# Altium project IT_SENSOR_PCB.PrjPcb (part 1 of 2)
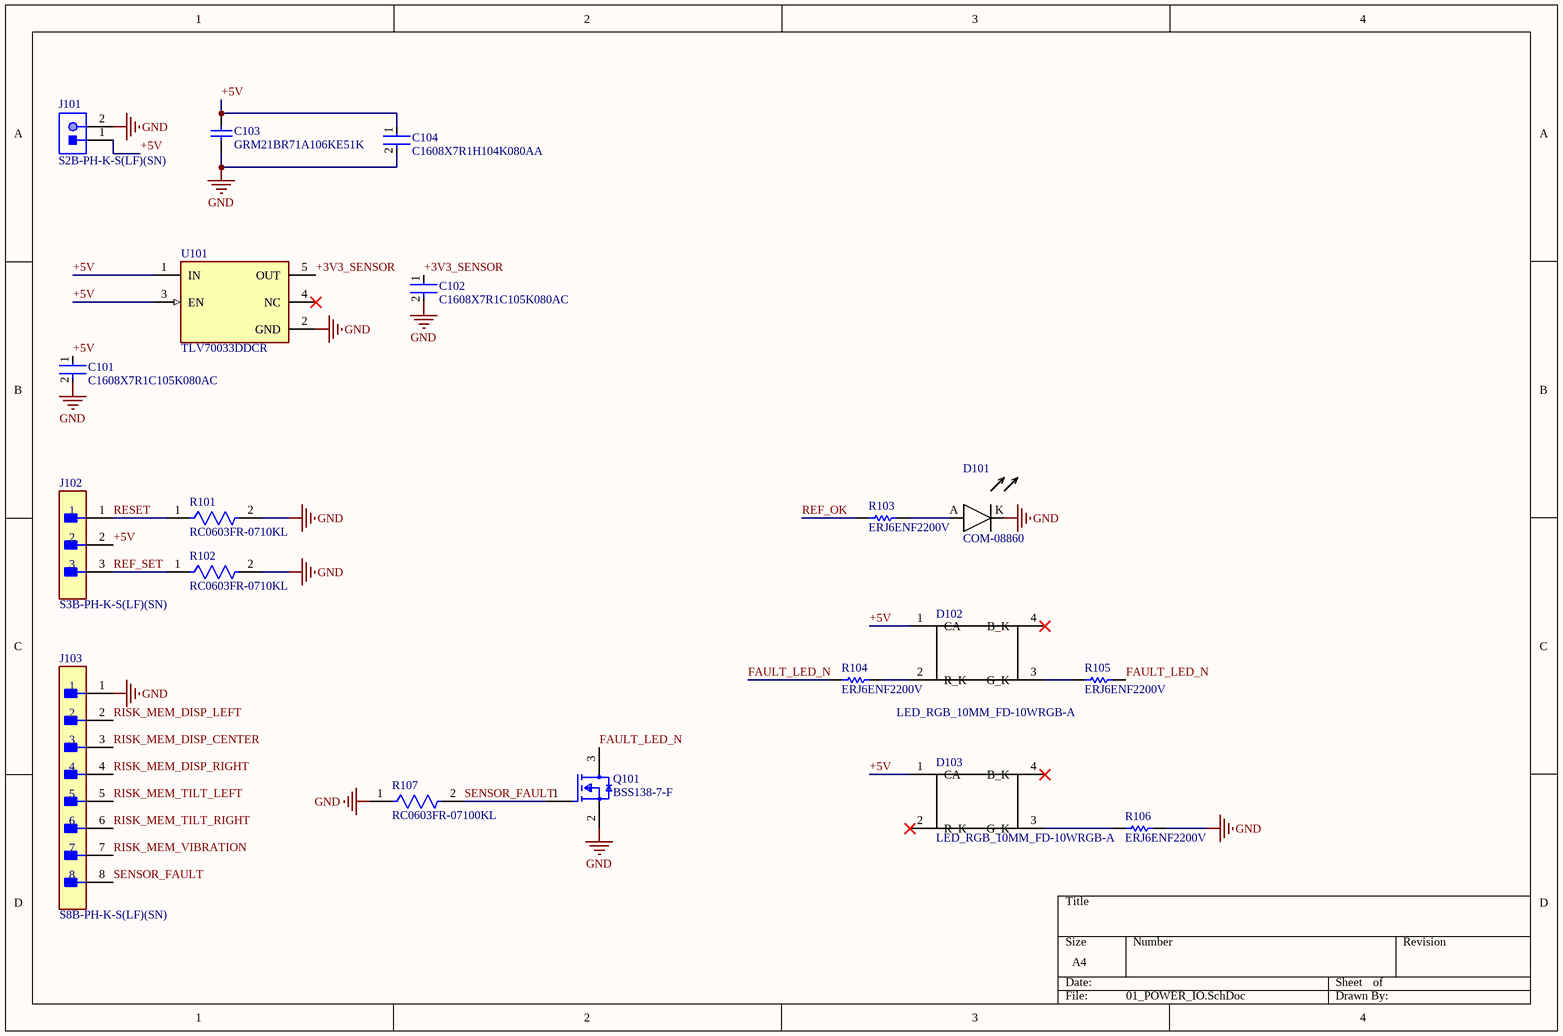
[diagram p0: 01_POWER_IO.SchDoc]
6 sheets, 106 parts. Net scope: global (net labels, ports and power ports of the same name join across sheets).
Board file: IT_SENSOR_PCB.PcbDoc
Sheets:
  01_POWER_IO.SchDoc
  02_DISPLACEMENT.SchDoc
  03_TILT_REF.SchDoc
  04_VIBRATION_FAULT.SchDoc
  05_RISK_MEMORY.SchDoc
  06_RISK_ALERT.SchDoc

## Sheet 01_POWER_IO.SchDoc
size A4; SheetNumber: 1; SheetTotal: 6

### Parts
C101  C1608X7R1C105K080AC  [FP-C1608-080-0_1-IPC_B]
C102  C1608X7R1C105K080AC  [FP-C1608-080-0_1-IPC_B]
C103  GRM21BR71A106KE51K  [CAPC2013X140X45ML15T25]
C104  C1608X7R1H104K080AA  [FP-C1608-080-0_1-IPC_B]
D101  COM-08860  [LED_10MM_COM-08860]
D102  LED_RGB_10MM_FD-10WRGB-A  [LED_THT_RGB_10MM_FD10WRGBA]
D103  LED_RGB_10MM_FD-10WRGB-A  [LED_THT_RGB_10MM_FD10WRGBA]
J101  S2B-PH-K-S(LF)(SN)  [JST-S2B-PH-K-S_V]
J102  S3B-PH-K-S(LF)(SN)  [FP-S3B-PH-K-S_LF_SN-MFG]
J103  S8B-PH-K-S(LF)(SN)  [FP-S8B-PH-K-S_LF_SN-MFG]
Q101  BSS138-7-F  [FP-SOT23_Standard-MFG]
R101  RC0603FR-0710KL  [FP-RC0603-0_55-IPC_C]
R102  RC0603FR-0710KL  [FP-RC0603-0_55-IPC_C]
R103  ERJ6ENF2200V  [RESC2013X70X40NL20T20]
R104  ERJ6ENF2200V  [RESC2013X70X40NL20T20]
R105  ERJ6ENF2200V  [RESC2013X70X40NL20T20]
R106  ERJ6ENF2200V  [RESC2013X70X40NL20T20]
R107  RC0603FR-07100KL  [FP-RC0603-0_55-MFG]
U101  TLV70033DDCR  [FP-DDC0005A-IPC_A]

### Nets
GND: C101.2 C102.2 C103.1 C104.2 D101.K(CATHODE) J101.2 J103.1 Q101.2(S) R101.2 R102.2 R106.2 R107.1 U101.2(GND)
+3V3_SENSOR: C102.1 U101.5(OUT)
+5V: C101.1 C103.2 C104.1 D102.1(CA) D103.1(CA) J101.1 J102.2 U101.1(IN) U101.3(EN)
FAULT_LED_N: Q101.3(D) R104.1 R105.2
REF_OK: R103.1
REF_SET: J102.3 R102.1
RESET: J102.1 R101.1
RISK_MEM_DISP_CENTER: J103.3
RISK_MEM_DISP_LEFT: J103.2
RISK_MEM_DISP_RIGHT: J103.4
RISK_MEM_TILT_LEFT: J103.5
RISK_MEM_TILT_RIGHT: J103.6
RISK_MEM_VIBRATION: J103.7
SENSOR_FAULT: J103.8 Q101.1(G) R107.2
NetD101_A: D101.A(ANODE) R103.2
NetD102_2: D102.2(R_K) R104.2
NetD102_3: D102.3(G_K) R105.1
NetD103_3: D103.3(G_K) R106.1

Not connected (* = marked no-connect by the designer): D102 4(B_K)*; D103 2(R_K)* 4(B_K)*; U101 4(NC)*

### Notes on the sheet
- (in symbol CMP-05427-000141-1) +
- (in symbol SC56-11EWA) A; B; C; D; E; F; G; DP

### Library data of the parts
C101 C102 = CMP-08246-002727-1: Multilayer Ceramic Capacitors 1μF ±10% 16V X7R SMD 0603; Capacitance: 1uF; Mount: Surface Mount; Width: 0.031inch; Radiation Hardening: No; Dielectric Material: Ceramic; Packaging: Tape and Reel; Voltage Rating: 16V; Weight: 7.1E-05oz; Termination: SMD/SMT; Package Quantity: 1; Voltage Rating (DC): 16V; REACH SVHC: No SVHC; Voltage: 16V; Min Operating Temperature: -55°C; Depth: 0.8mm; Height: 0.8mm; Length: 1.6mm; Case Code (Metric): 1608; Thickness: 0.037inch; Lead Free: Lead Free; Resistor Type: Ceramic; RoHS Compliant: Yes; Series: C; Construction: Flat; Max Operating Temperature: 125°C; Tolerance: 10%; Case/Package: 0603; Dielectric: X7R; Case Code (Imperial): 0603
C103 = CMP-2007-03370-1: Manufacturer: Murata; Part Number: GRM21BR71A106KE51K
C104 = CMP-2000-04982-2: Multilayer Ceramic Capacitors 100nF ±10% 50V X7R SMD 0603; REACH SVHC: No SVHC; Voltage: 50V; Min Operating Temperature: -55°C; Package Quantity: 1; Case Code (Metric): 1608; Series: C; Termination: SMD/SMT; Length: 1.6mm; Voltage Rating: 50V; Case Code (Imperial): 0603; Number of Pins: 2; RoHS Compliant: Yes; Thickness: 0.037inch; Resistor Type: Ceramic; Radiation Hardening: No; Weight: 7.1E-05oz; Mount: Surface Mount; Capacitance: 100nF; Voltage Rating (DC): 50V; Construction: Flat; Tolerance: 10%; Lead Free: Lead Free; Case/Package: 0603; Max Operating Temperature: 125°C; Height: 0.8mm; Depth: 0.8mm; Packaging: Tape and Reel; Width: 0.031inch; Dielectric Material: Ceramic; Dielectric: X7R
D101 = COM-08860: Blue 10mm THT LED
J101 = CMP-1755-00004-1: Male Header, Pitch 2 mm, 1 x 2 Position, Height 4.8 mm, Tail Length 3.4 mm, -25 to 85 degC, RoHS, Bulk; Case\Package: Radial; Tolerance: 20%; Capacitance: 10 uF; Voltage Rating (DC): 50 V; Packaging: Bulk; ComponentLink1URL: http://www.jst-mfg.com/product/pdf/eng/ePH.pdf; Radiation Hardening: No; Height: 11 mm; Package Quantity: 200; PackageDescription: Male Header, Pitch 2 mm, 1 x 2 Position, Height 4.8 mm, Tail Length 3.4 mm; PackageReference: S2B-PH-K-S; Diameter: 5 mm; Pins: 2; Mount: Through Hole; Max Operating Temperature: 85 degC; Min Operating Temperature: -40 degC; ComponentLink1Description: Datasheet; DatasheetVersion: Dec-12; Length: 11 mm; Lead Pitch: 2 mm; REACH SVHC: No SVHC; Voltage Rating: 50 V; RoHSCompliant: true
J102 = CMP-17439-000039-1: CONN HEADER R/A 3POS 2MM; Height: 0.31inch; Weight: 0.0625lb; Length: 0.31inch; Width: 0.31inch
J103 = CMP-17439-000161-1: CONN HEADER R/A 8POS 2MM; Number of Positions: 8; Voltage Rating: 100V; Insulation Resistance: 1GR; Current Rating: 2A; Gender: Male; Contact Resistance: 20mR; Contact Mating Length: 0.13inch; Width: 4.5mm; Contact Finish - Mating: TIN; Insulation Color: Natural; Housing Color: White; Depth: 7.6mm; Min Operating Temperature: -25°C; Lead Pitch: 2mm; Number of Poles: 8; Number of Rows: 1; Height: 9.4mm; REACH SVHC: No SVHC; Contact Type: Male Pin; Length: 17.9mm; Lead Free: Lead Free; Pitch: 2mm; Number of Contacts: 8; Orientation: Right Angle; Flammability Rating: UL94 V-0; Max Operating Temperature: 85°C; Mount: Through Hole; Contact Shape: Square; Termination: Solder; Fastening Type: Detent; Packaging: Bulk; Series: PH; Voltage Rating (AC): 100V; Insulation Material: Nylon; Working Voltage: 100V; Contact Plating: Tin; Housing Material: Polyamide; Connector Type: Header; Number of Pins: 8; Max Voltage Rating (AC): 100V; Max Current Rating: 2A; Contact Material: Brass; Color: White
Q101 = CMP-2000-04930-2: NexarPartId: 335900; Voltage: 50V; Fall Time: 25ns; Number of Elements: 1; Turn-On Delay Time: 20ns; Drain to Source Resistance: 1.4Ω; Element Configuration: Single; Max Power Dissipation: 300mW; Current Rating: 200mA; Max Junction Temperature (Tj): 150°C; Input Capacitance: 50pF; Threshold Voltage: 1.2V; Current: 2A; Rds On Max: 3.5Ω; Rise Time: 10ns; Gate to Source Voltage (Vgs): 20V; Number of Pins: 3; Width: 1.3mm; Case/Package: SOT-23; Lead Free: Lead Free; Height: 1.15mm; Packaging: Cut Tape; Length: 2.9mm; REACH SVHC: No SVHC; Weight: 7.994566mg; Voltage Rating (DC): 50V; Contact Plating: Tin; Power Dissipation: 300mW; Mount: Surface Mount; Min Operating Temperature: -55°C; RoHS: Compliant; Max Operating Temperature: 150°C; Schedule B: 8541210080, 8541210080; Drain to Source Breakdown Voltage: 50V; Continuous Drain Current (ID): 200mA; Resistance: 3.5Ω; Number of Channels: 1; Drain to Source Voltage (Vdss): 50V; Turn-Off Delay Time: 20ns; Nominal Vgs: 1.2V
R101 R102 = CMP-2100-03664-2: RES 10K OHM 1% 1/10W 0603; Voltage Rating: 75V; Voltage Rating (DC): 50V; Resistance: 10kR; Power Rating: 100mW; Temperature Coefficient: 100ppm/°C; Depth: 0.8mm; Termination: SMD/SMT; Resistor Type: Thick Film; Series: RC; Construction: Rectangular; Features: Moisture Resistant; Packaging: Tape and Reel; Min Operating Temperature: -55°C; Number of Terminations: 2; Lead Pitch: 0.3mm; RoHS Compliant: Yes; Case/Package: 0603; Resistance Tolerance: 1%; Military Standard: Not; Weight: 7.1E-05oz; Number of Pins: 2; Tolerance: 1%; Length: 1.6mm; Case Code (Imperial): 0603; Lead Free: Lead Free; Width: 0.8mm; Max Power Dissipation: 100mW; Height: 0.45mm; Max Operating Temperature: 155°C; Case Code (Metric): 1608; Size Code: 0603
R103-R106 = CMP-2001-00044-1: Manufacturer: Panasonic; Part Number: ERJ6ENF2200V
R107 = CMP-2100-03662-2: RES SMD 100K OHM 1% 1/10W 0603; Voltage Rating (DC): 50V; Resistance: 100kR; Max Power Dissipation: 100mW; Temperature Coefficient: 100ppm/°C; Working Voltage: 75V; Length: 1.6mm; Lead Free: Lead Free; Number of Terminations: 2; Packaging: Tape and Reel; Voltage Rating: 50V; Termination: SMD/SMT; Width: 0.8mm; Resistor Type: Thick Film; Resistance Tolerance: 1%; Features: Moisture Resistant; Height: 0.45mm; Construction: Rectangular; Case/Package: 0603; Military Standard: Not; Case Code (Imperial): 0603; Series: RC; Technology: THICK FILM; Depth: 0.8mm; RoHS Compliant: Yes; REACH SVHC: No SVHC; Min Operating Temperature: -55°C; Case Code (Metric): 1608; Max Operating Temperature: 155°C; Power Rating: 100mW; Number of Pins: 2; Tolerance: 1%
U101 = CMP-0394-01056-3: IC REG LINEAR 3.3V 200MA SOT23-5; Number of Outputs: 1; Max Input Voltage: 5.5V; Dropout Voltage: 175mV; Output Voltage Accuracy: 2%; Min Current Limit: 220mA; Min Input Voltage: 2V; Max Power Dissipation: 500mW; Polarity: Positive; Output Type: Fixed; Quiescent Current: 30uA; Output Current: 200mA; Min Operating Temperature: -40°C; Number of Pins: 5; Package Quantity: 1; Max Operating Temperature: 125°C; Case/Package: TSOT; Max Output Voltage: 3.3V; Max Output Current: 200mA; REACH SVHC: No SVHC; Accuracy: 2%; Lead Free: Lead Free; Output Voltage: 3.3V; Radiation Hardening: No; Packaging: Tape and Reel; Nominal Output Voltage: 3.3V; Power Dissipation: 500mW; Number of Regulators: 1; Min Output Voltage: 3.3V

## Sheet 02_DISPLACEMENT.SchDoc
size A4; SheetNumber: 2; SheetTotal: 6
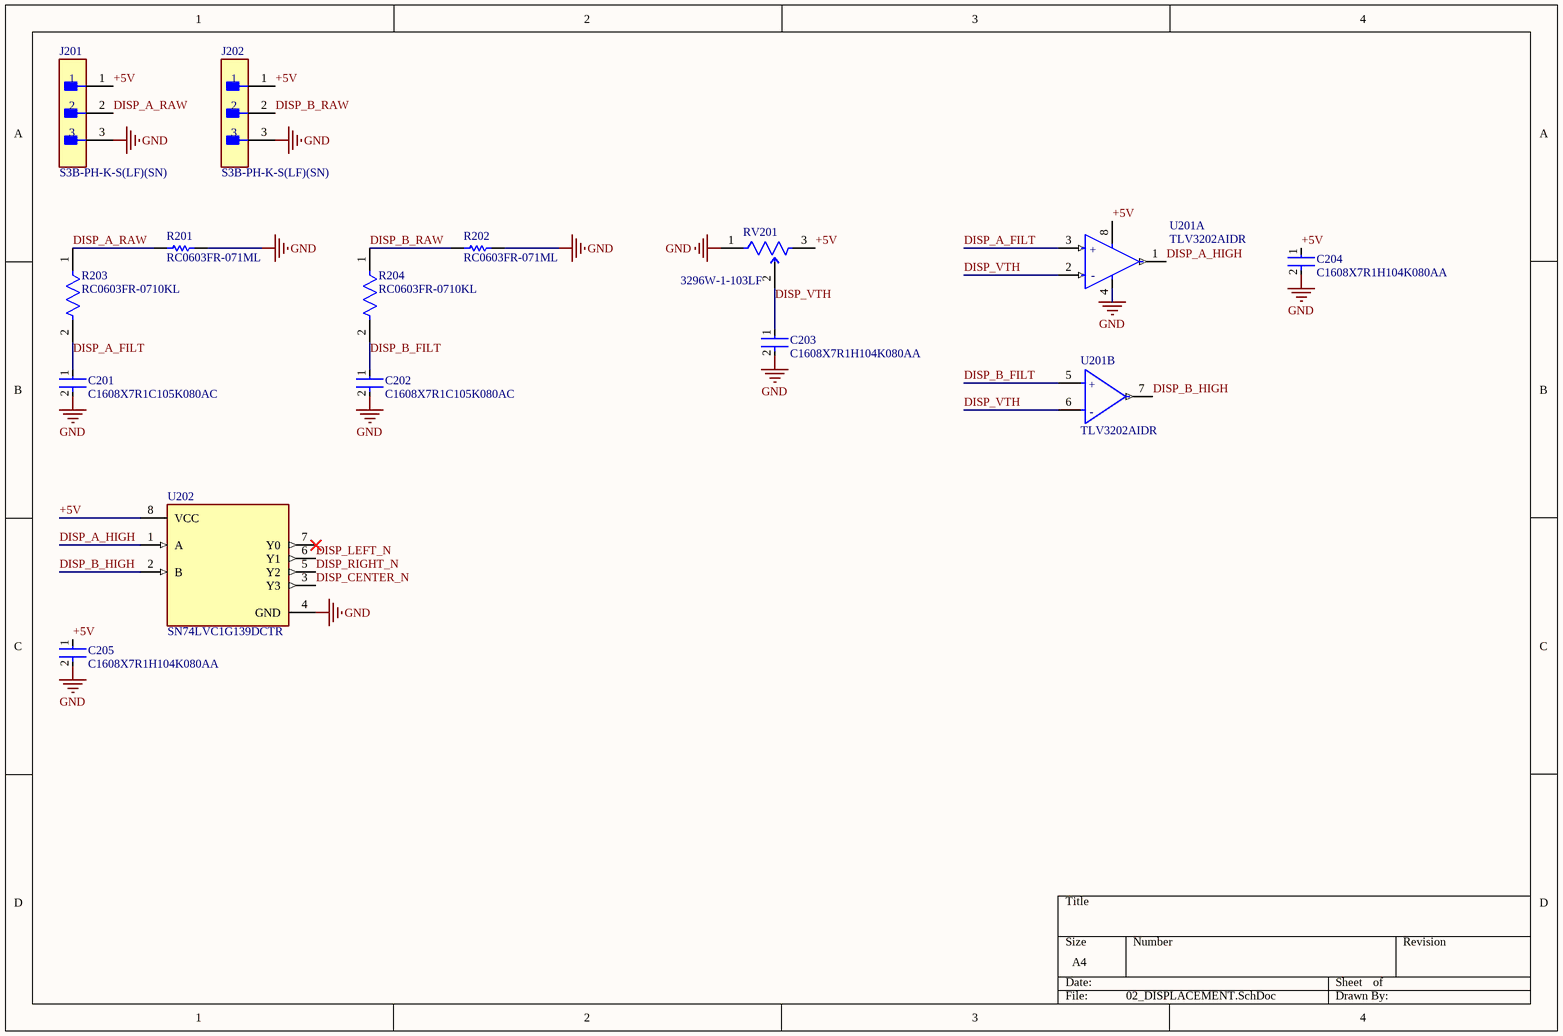
[diagram p1: 02_DISPLACEMENT.SchDoc]

### Parts
C201  C1608X7R1C105K080AC  [FP-C1608-080-0_1-IPC_B]
C202  C1608X7R1C105K080AC  [FP-C1608-080-0_1-IPC_B]
C203  C1608X7R1H104K080AA  [FP-C1608-080-0_1-IPC_B]
C204  C1608X7R1H104K080AA  [FP-C1608-080-0_1-IPC_B]
C205  C1608X7R1H104K080AA  [FP-C1608-080-0_1-IPC_B]
J201  S3B-PH-K-S(LF)(SN)  [FP-S3B-PH-K-S_LF_SN-MFG]
J202  S3B-PH-K-S(LF)(SN)  [FP-S3B-PH-K-S_LF_SN-MFG]
R201  RC0603FR-071ML  [RESC1608X55X25LL10T15]
R202  RC0603FR-071ML  [RESC1608X55X25LL10T15]
R203  RC0603FR-0710KL  [FP-RC0603-0_55-IPC_C]
R204  RC0603FR-0710KL  [FP-RC0603-0_55-IPC_C]
RV201  3296W-1-103LF  [FP-3296W-MFG]
U201  TLV3202AIDR  [FP-D0008A-IPC_B]  (parts A,B of 2)
U202  SN74LVC1G139DCTR  [FP-DCT0008A-MFG]

### Nets
GND: C201.2 C202.2 C203.2 C204.2 C205.2 J201.3 J202.3 R201.2 R202.2 RV201.1(CCW) U201.4(GND) U202.4(GND)
+5V: C204.1 C205.1 J201.1 J202.1 RV201.3(CW) U201.8(VCC) U202.8(VCC)
DISP_A_FILT: C201.1 R203.2 U201.3(1IN+)
DISP_A_HIGH: U201.1(1OUT) U202.1(A)
DISP_A_RAW: J201.2 R201.1 R203.1
DISP_B_FILT: C202.1 R204.2 U201.5(2IN+)
DISP_B_HIGH: U201.7(2OUT) U202.2(B)
DISP_B_RAW: J202.2 R202.1 R204.1
DISP_CENTER_N: U202.3(Y3)
DISP_LEFT_N: U202.6(Y1)
DISP_RIGHT_N: U202.5(Y2)
DISP_VTH: C203.1 RV201.2(WIPER) U201.2(1IN-) U201.6(2IN-)

Not connected (* = marked no-connect by the designer): U202 7(Y0)*

### Notes on the sheet
- (in symbol CMP-04896-000095-1, part A) +; -
- (in symbol CMP-04896-000095-1, part B) +; -

### Library data of the parts
C201 C202 = CMP-08246-002727-1: as C101 on sheet 01_POWER_IO; Mount: Surface Mount; Width: 0.031inch; Radiation Hardening: No; Dielectric Material: Ceramic; Packaging: Tape and Reel; Voltage Rating: 16V; Weight: 7.1E-05oz; Termination: SMD/SMT; Package Quantity: 1; Voltage Rating (DC): 16V; REACH SVHC: No SVHC; Voltage: 16V; Min Operating Temperature: -55°C; Depth: 0.8mm; Height: 0.8mm; Length: 1.6mm; Case Code (Metric): 1608; Thickness: 0.037inch; Lead Free: Lead Free; Resistor Type: Ceramic; RoHS Compliant: Yes; Series: C; Construction: Flat; Max Operating Temperature: 125°C; Tolerance: 10%; Case/Package: 0603; Dielectric: X7R; Case Code (Imperial): 0603
C203-C205 = CMP-2000-04982-2: as C104 on sheet 01_POWER_IO; REACH SVHC: No SVHC; Voltage: 50V; Min Operating Temperature: -55°C; Package Quantity: 1; Case Code (Metric): 1608; Series: C; Termination: SMD/SMT; Length: 1.6mm; Voltage Rating: 50V; Case Code (Imperial): 0603; Number of Pins: 2; RoHS Compliant: Yes; Thickness: 0.037inch; Resistor Type: Ceramic; Radiation Hardening: No; Weight: 7.1E-05oz; Mount: Surface Mount; Capacitance: 100nF; Voltage Rating (DC): 50V; Construction: Flat; Tolerance: 10%; Lead Free: Lead Free; Case/Package: 0603; Max Operating Temperature: 125°C; Height: 0.8mm; Depth: 0.8mm; Packaging: Tape and Reel; Width: 0.031inch; Dielectric Material: Ceramic; Dielectric: X7R
J201 J202 = CMP-17439-000039-1: CONN HEADER R/A 3POS 2MM; Height: 0.31inch; Weight: 0.0625lb; Length: 0.31inch; Width: 0.31inch
R201 R202 = CMP-1659-00056-1: Chip Resistor, 1 MOhm, +/- 1%, 100 mW, -55 to 155 degC, 0603 (1608 Metric), RoHS, Tape and Reel; Voltage Rating (DC): 25 V; Tolerance: 20%; Case\Package: Radial; Capacitance: 1 mF; Min Operating Temperature: -40 degC; PackageDescription: 2-Pin Surface Mount Device, Body 1.6 x 0.8 mm; ComponentLink1Description: Manufacturer URL; Radiation Hardening: No; DatasheetVersion: Rev. 4, 02/2016; REACH SVHC: No SVHC; Length: 20 mm; Max Operating Temperature: 85 degC; Diameter: 10 mm; Packaging: Bulk; Package Quantity: 200; PackageReference: 0603; Mount: Through Hole; ComponentLink1URL: http://www.yageo.com/; ComponentLink2URL: http://www.yageo.com/documents/recent/PYu-RC_Group_51_RoHS_L_04.pdf; ComponentLink2Description: Datasheet; Width: 0 inch; Lead Pitch: 5 mm; RoHSCompliant: true; Voltage Rating: 25 V; Height: 20 mm
R203 R204 = CMP-2100-03664-2: as R101 on sheet 01_POWER_IO; Depth: 0.8mm; Termination: SMD/SMT; Resistor Type: Thick Film; Series: RC; Construction: Rectangular; Features: Moisture Resistant; Packaging: Tape and Reel; Min Operating Temperature: -55°C; Number of Terminations: 2; Lead Pitch: 0.3mm; RoHS Compliant: Yes; Case/Package: 0603; Resistance Tolerance: 1%; Military Standard: Not; Weight: 7.1E-05oz; Number of Pins: 2; Tolerance: 1%; Length: 1.6mm; Case Code (Imperial): 0603; Lead Free: Lead Free; Width: 0.8mm; Max Power Dissipation: 100mW; Height: 0.45mm; Max Operating Temperature: 155°C; Case Code (Metric): 1608; Size Code: 0603
RV201 = CMP-1747-00001-8: TRIMMER 10K OHM 0.5W PC PIN TOP; Number of Turns: 25; Tolerance: 10%; Resistance: 10kR; Max Power Dissipation: 500mW; Temperature Coefficient: 100ppm/°C; Insulation Resistance: 1GR; Min Operating Temperature: -55°C; Resistor Type: Cermet; Series: 3296; Color: Blue; Mount: Through Hole; Taper: Linear; Radiation Hardening: No; RoHS Compliant: Yes; Width: 9.53mm; Resistance Tolerance: 10%; Contact Plating: Tin; Military Standard: Not; Package Quantity: 50; Weight: 0.03oz; Lead Free: Lead Free; Power Rating: 500mW; Termination: Pin; Technology: CERMET; Max Operating Temperature: 125°C; Packaging: Rail/Tube; Length: 9.53mm; Depth: 4.83mm; Height: 11.55mm; Reach SVHC Compliant: Yes
U201 = CMP-04896-000095-1: IC COMPARATOR RRI DUAL 8SOIC; Power Supply Rejection Ratio (PSRR): 85dB; Output Type: PUSH-PULL; Number of Channels: 2; Propagation Delay: 50ns; Input Bias Current: 50pA; Hysteresis: 1.2mV; Common Mode Rejection Ratio: 70dB; Max Supply Current: 40uA; Response Time: 0.047us; Max Supply Voltage: 5.5V; Quiescent Current: 50uA; Min Supply Voltage: 2.7V; Input Offset Voltage (Vos): 5mV; Number of Pins: 8; Series: TLV3202; Type: General Purpose; Max Operating Temperature: 125°C; Packaging: Tape and Reel; Mount: Surface Mount; Max Input Current: 50pA; RoHS Compliant: Yes; Package Quantity: 2500; Case/Package: SOIC; Radiation Hardening: No; Contact Plating: Gold; Min Operating Temperature: -40°C; Number of Elements: 2; Lead Free: Lead Free; Supply Current: 50uA; Nominal Supply Current: 50uA
U202 = CMP-0859-00561-4: IC DECODER/DEMUX 1 X 2:4 SM8; Supply Type: Single; Low Level Output Current: 32mA; Number of Bits: 1; Throw Configuration: DP4T; Max Supply Voltage: 5.5V; Logic Function: Demultiplexer; Polarity: Inverting; Number of Outputs: 4; Propagation Delay: 16.7ns; Number of Inputs: 2; Quiescent Current: 10uA; Min Supply Voltage: 1.65V; High Level Output Current: -32mA; Case/Package: SSOP; Independent Circuits: 1; Lead Free: Lead Free; Number of Elements: 1; Packaging: Tape and Reel; Mount: Surface Mount; REACH SVHC: No SVHC; Contact Plating: Gold; Number of Circuits: 1; Radiation Hardening: No; Number of Pins: 8; Number of Input Lines: 2; Weight: 0.000825oz; Min Operating Temperature: -40°C; Max Operating Temperature: 85°C; Package Quantity: 3000; Number of Output Lines: 4

## Sheet 03_TILT_REF.SchDoc
size A4; SheetNumber: 3; SheetTotal: 6
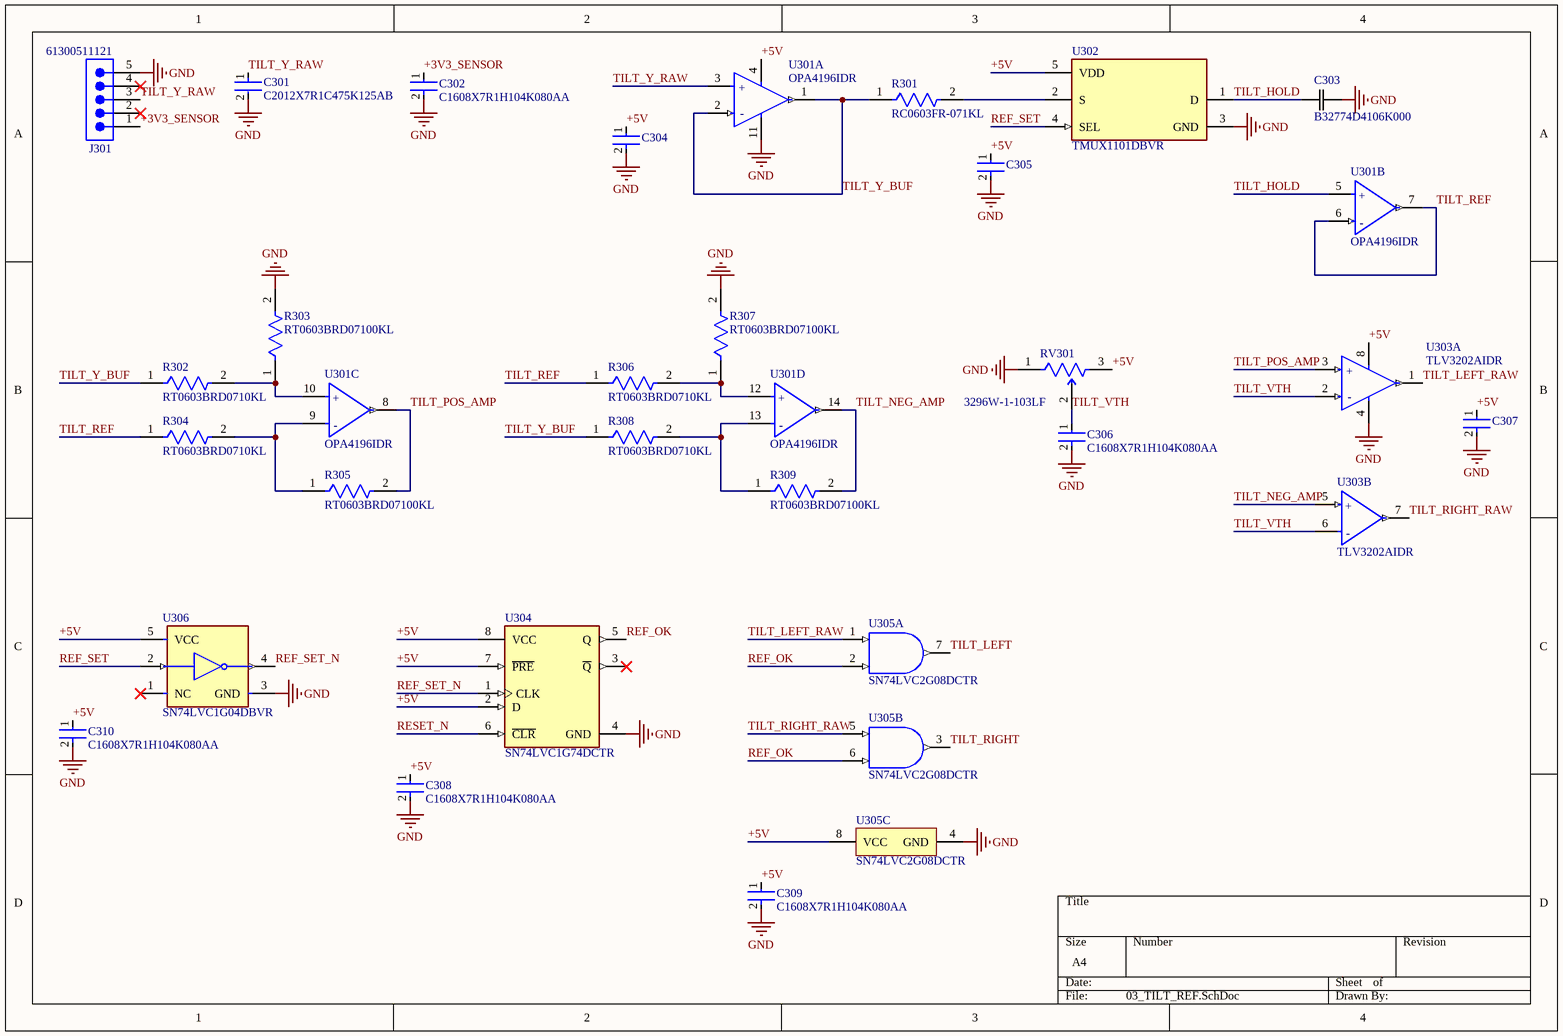
[diagram p2: 03_TILT_REF.SchDoc]

### Parts
C301  C2012X7R1C475K125AB  [FP-C2012-125-0_2-IPC_A]
C302  C1608X7R1H104K080AA  [FP-C1608-080-0_1-IPC_B]
C303  B32774D4106K000  [CAP_B32774D4106J000_TDK]
C304  C1608X7R1H104K080AA  [FP-C1608-080-0_1-IPC_B]  (value not drawn)
C305  C1608X7R1H104K080AA  [FP-C1608-080-0_1-IPC_B]  (value not drawn)
C306  C1608X7R1H104K080AA  [FP-C1608-080-0_1-IPC_B]
C307  C1608X7R1H104K080AA  [FP-C1608-080-0_1-IPC_B]  (value not drawn)
C308  C1608X7R1H104K080AA  [FP-C1608-080-0_1-IPC_B]
C309  C1608X7R1H104K080AA  [FP-C1608-080-0_1-IPC_B]
C310  C1608X7R1H104K080AA  [FP-C1608-080-0_1-IPC_B]
J301  61300511121  [61300511121]
R301  RC0603FR-071KL  [FP-RC0603-0_55-IPC_C]
R302  RT0603BRD0710KL  [FP-RT0603-MFG]
R303  RT0603BRD07100KL  [FP-RT0603-MFG]
R304  RT0603BRD0710KL  [FP-RT0603-MFG]
R305  RT0603BRD07100KL  [FP-RT0603-MFG]
R306  RT0603BRD0710KL  [FP-RT0603-MFG]
R307  RT0603BRD07100KL  [FP-RT0603-MFG]
R308  RT0603BRD0710KL  [FP-RT0603-MFG]
R309  RT0603BRD07100KL  [FP-RT0603-MFG]
RV301  3296W-1-103LF  [FP-3296W-MFG]
U301  OPA4196IDR  [FP-D0014A-IPC_A]  (parts A,B,C,D of 4)
U302  TMUX1101DBVR  [FP-DBV0005A-MFG]
U303  TLV3202AIDR  [FP-D0008A-IPC_B]  (parts A,B of 2)
U304  SN74LVC1G74DCTR  [FP-DCT0008A-MFG]
U305  SN74LVC2G08DCTR  [DCT0008A_M]  (parts A,B,C of 3)
U306  SN74LVC1G04DBVR  [FP-DBV0005A-MFG]

### Nets
GND: C301.2 C302.2 C303.2 C304.2 C305.2 C306.2 C307.2 C308.2 C309.2 C310.2 J301.5 R303.2 R307.2 RV301.1(CCW) U301.11(V-) U302.3(GND) U303.4(GND) U304.4(GND) U305.4(GND) U306.3(GND)
+3V3_SENSOR: C302.1 J301.1
+5V: C304.1 C305.1 C307.1 C308.1 C309.1 C310.1 RV301.3(CW) U301.4(V+) U302.5(VDD) U303.8(VCC) U304.2(D) U304.7(~{PRE}) U304.8(VCC) U305.8(VCC) U306.5(VCC)
REF_OK: U304.5(Q) U305.2(1B) U305.6(2B)
REF_SET: U302.4(SEL) U306.2(A)
REF_SET_N: U304.1(CLK) U306.4(Y)
RESET_N: U304.6(~{CLR})
TILT_HOLD: C303.1 U301.5(+IN_B) U302.1(D)
TILT_LEFT: U305.7(1Y)
TILT_LEFT_RAW: U303.1(1OUT) U305.1(1A)
TILT_NEG_AMP: R309.2 U301.14(OUT_D) U303.5(2IN+)
TILT_POS_AMP: R305.2 U301.8(OUT_C) U303.3(1IN+)
TILT_REF: R304.1 R306.1 U301.6(-IN_B) U301.7(OUT_B)
TILT_RIGHT: U305.3(2Y)
TILT_RIGHT_RAW: U303.7(2OUT) U305.5(2A)
TILT_VTH: C306.1 RV301.2(WIPER) U303.2(1IN-) U303.6(2IN-)
TILT_Y_BUF: R301.1 R302.1 R308.1 U301.1(OUT_A) U301.2(-IN_A)
TILT_Y_RAW: C301.1 J301.3 U301.3(+IN_A)
NetR301_2: R301.2 U302.2(S)
NetR302_2: R302.2 R303.1 U301.10(+IN_C)
NetR304_2: R304.2 R305.1 U301.9(-IN_C)
NetR306_2: R306.2 R307.1 U301.12(+IN_D)
NetR308_2: R308.2 R309.1 U301.13(-IN_D)

Not connected (* = marked no-connect by the designer): J301 2* 4*; U304 3(~{Q})*; U306 1(NC)*

### Notes on the sheet
- (in symbol CMP-04895-000120-1, part A) +; -
- (in symbol CMP-04895-000120-1, part B) +; -
- (in symbol CMP-04895-000120-1, part C) +; -
- (in symbol CMP-04895-000120-1, part D) +; -
- (in symbol CMP-04896-000095-1, part A) +; -
- (in symbol CMP-04896-000095-1, part B) +; -

### Library data of the parts
C301 = CMP-08246-006097-1: Multilayer Ceramic Capacitors 4.7μF ±10% 16V X7R SMD 0805; Capacitance: 4.7uF; Resistor Type: Ceramic; Series: C; Max Operating Temperature: 125°C; RoHS Compliant: Yes; Package Quantity: 1; Case/Package: 0805; Radiation Hardening: No; REACH SVHC: No SVHC; Width: 0.049inch; Min Operating Temperature: -55°C; Height: 1.25mm; Length: 2mm; Thickness: 0.057inch; Depth: 1.25mm; Packaging: Tape and Reel; Dielectric Material: Ceramic; Tolerance: 10%; Weight: 0.000194oz; Voltage Rating: 16V; Dielectric: X7R; Termination: SMD/SMT; Mount: Surface Mount; Case Code (Imperial): 0805; Lead Free: Lead Free; Number of Pins: 2; Construction: Flat; Case Code (Metric): 2012; Voltage Rating (DC): 16V
C302 C304-C310 = CMP-2000-04982-2: as C104 on sheet 01_POWER_IO; REACH SVHC: No SVHC; Voltage: 50V; Min Operating Temperature: -55°C; Package Quantity: 1; Case Code (Metric): 1608; Series: C; Termination: SMD/SMT; Length: 1.6mm; Voltage Rating: 50V; Case Code (Imperial): 0603; Number of Pins: 2; RoHS Compliant: Yes; Thickness: 0.037inch; Resistor Type: Ceramic; Radiation Hardening: No; Weight: 7.1E-05oz; Mount: Surface Mount; Capacitance: 100nF; Voltage Rating (DC): 50V; Construction: Flat; Tolerance: 10%; Lead Free: Lead Free; Case/Package: 0603; Max Operating Temperature: 125°C; Height: 0.8mm; Depth: 0.8mm; Packaging: Tape and Reel; Width: 0.031inch; Dielectric Material: Ceramic; Dielectric: X7R
C303 = B32774D4106K000: Description; Manufacturer_Name: TDK; Copyright: Copyright (C) 2025 Ultra Librarian. All rights reserved.; Manufacturer_Part_Number: B32774D4106K000
J301 = CMP-1502-01068-4: THT Vertical Pin Header WR-PHD, Pitch 2.54 mm, Single Row, 5 pins; Number of Contacts: 5; Connector Type: Male Pin; Operating Supply Voltage: 250V; Contact Resistance: 20mΩ; Gender: Male; Pitch: 2.54mm; Current Rating: 3A; Min Operating Temperature: -40°C; Contact Material: Gold; Color: Black; RoHS: Compliant; Number of Rows: 1; Lead Free: Lead Free; Height: 8.89mm; Contact Plating: Gold; Number of Pins: 5; Orientation: Vertical; Voltage Rating: 250V; Packaging: Bulk; Number of Positions: 5; Max Operating Temperature: 105°C; Termination: Solder; Lead Pitch: 2.54mm; Contact Mating Length: 5.9944mm; Mount: Through Hole
R301 = CMP-1659-00009-5: RES 1K OHM 1% 1/10W 0603; Resistance: 1kR; Voltage Rating: 50V; Power Rating: 100mW; Temperature Coefficient: 100ppm/°C; Military Standard: Not; REACH SVHC: No SVHC; Size Code: 0603; Features: Moisture Resistant; Number of Terminations: 2; Technology: THICK FILM; Series: RC; Case Code (Metric): 1608; Resistance Tolerance: 1%; Resistor Type: Thick Film; Termination: SMD/SMT; Contact Plating: Tin; Radiation Hardening: No; Min Operating Temperature: -55°C; Max Operating Temperature: 155°C; Packaging: Tape and Reel; Max Power Dissipation: 100mW; RoHS Compliant: Yes; Height: 0.45mm; Lead Free: Lead Free; Case/Package: 0603; Length: 1.6mm; Tolerance: 1%; Case Code (Imperial): 0603; Construction: Rectangular; Depth: 0.8mm
R302 R304 R306 R308 = CMP-03412-000619-1: RES 10.0K OHM 1/10W .1% SMD 0603; Manufacturer: Yageo; Resistance: 10KΩ; Value: 10KΩ; Tolerance: 0.001; Power Rating: 0.1W; Voltage Rating: 75V; Temperature Coefficient: 25 ppm/°C; Device Class L2: Resistors; Mouser Description: Thin Film Resistors - SMD 10K ohm 0.1% 1/10W; Digikey Description: RES 10.0K OHM 1/10W .1% SMD 0603; Temperature: -55°C to +155°C; Device Class L3: Chip SMD Resistors; Temperature Range Low: -55°C; Lead Free: Yes; Series: RT; ComponentLink2URL: http://www.yageo.com/documents/recent/PYu-RT_1-to-0.01_RoHS_L_9.pdf; Automotive: No; Ipc Land Pattern Name: RESC16080X45; Composition: Thin Film; Manufacturer Part Number: RT0603BRD0710KL; Footprint Url: http://www.yageo.com/exep/pages/download/literatures/PYu-R_Mount_10.pdf; Temperature Range High: +155°C; Device Class L1: Passive Components; Height: 0.55mm; Category: Res; Octopart: https://octopart.com/rt0603brd0710kl-yageo-1399221; Package: RT0603; RoHS: TRUE; ComponentLink2Description: Datasheet
R303 R305 R307 R309 = CMP-2000-04343-2: RES 100K OHM 1/10W .1% SMD 0603; Manufacturer: Yageo; Voltage Rating: 75V; Resistance: 100KΩ; Power Rating: 0.1W; Temperature Coefficient: 25 ppm/°C; Value: 100KΩ; Tolerance: 0.001; ComponentLink2URL: http://www.yageo.com/documents/recent/PYu-RT_1-to-0.01_RoHS_L_9.pdf; Device Class L1: Passive Components; Device Class L3: Chip SMD Resistors; Temperature: -55°C to +155°C; Temperature Range Low: -55°C; Temperature Range High: +155°C; Automotive: No; Series: RT; Device Class L2: Resistors; Digikey Description: RES 100K OHM 1/10W .1% SMD 0603; Composition: Thin Film; Height: 0.55mm; Lead Free: Yes; Manufacturer Part Number: RT0603BRD07100KL; Footprint Url: http://www.yageo.com/exep/pages/download/literatures/PYu-R_Mount_10.pdf; Octopart: https://octopart.com/rt0603brd07100kl-yageo-1402588; Category: Res; ComponentLink2Description: Datasheet; Ipc Land Pattern Name: RESC16080X45; Package: RT0603; RoHS: TRUE; Mouser Description: Resistor; Resistance: 100Kohm; Resistance Tolerance: ± 1%; Resistor Element Material:
RV301 = CMP-1747-00001-8: as RV201 on sheet 02_DISPLACEMENT; Min Operating Temperature: -55°C; Resistor Type: Cermet; Series: 3296; Color: Blue; Mount: Through Hole; Taper: Linear; Radiation Hardening: No; RoHS Compliant: Yes; Width: 9.53mm; Resistance Tolerance: 10%; Contact Plating: Tin; Military Standard: Not; Package Quantity: 50; Weight: 0.03oz; Lead Free: Lead Free; Power Rating: 500mW; Termination: Pin; Technology: CERMET; Max Operating Temperature: 125°C; Packaging: Rail/Tube; Length: 9.53mm; Depth: 4.83mm; Height: 11.55mm; Reach SVHC Compliant: Yes
U301 = CMP-04895-000120-1: IC OPAMP GP 4 CIRCUIT 14SOIC; Gain Bandwidth Product: 2.5MHz; Operating Supply Current: 140uA; Input Offset Voltage (Vos): 100uV; Input Bias Current: 20pA; Number of Channels: 4; Slew Rate: 7V/µs; Mount: Surface Mount; Packaging: Tape and Reel; Max Operating Temperature: 125°C; Case/Package: SOIC; Number of Circuits: 4; Number of Pins: 14; RoHS Compliant: Yes; Min Operating Temperature: -40°C
U302 = CMP-00370-99888634-1: TMUX1101DBVR 3-pA on-state leakage current, 5-V, 1: 1 (SPST), 1-channel precision switch (active high) 5-SOT-23 -40 to 125; Resistance: 4.9Ω; Number of Channels: 1; Thickness: 1.2mm; Manufacturer Lifecycle Status: ACTIVE; Width: 1.6mm; Lifecycle Status: Production; Schedule B: 8542390000; Height: 1.45mm; Case/Package: SOT-23; NexarPartId: 99888634; Number of Pins: 5; Length: 2.9mm
U303 = CMP-04896-000095-1: as U201 on sheet 02_DISPLACEMENT; Number of Pins: 8; Series: TLV3202; Type: General Purpose; Max Operating Temperature: 125°C; Packaging: Tape and Reel; Mount: Surface Mount; Max Input Current: 50pA; RoHS Compliant: Yes; Package Quantity: 2500; Case/Package: SOIC; Radiation Hardening: No; Contact Plating: Gold; Min Operating Temperature: -40°C; Number of Elements: 2; Lead Free: Lead Free; Supply Current: 50uA; Nominal Supply Current: 50uA
U304 = CMP-0859-00550-4: IC FF D-TYPE SNGL 1BIT SM8; Manufacturer: Texas Instruments; Propagation Delay: 6.4ns; Logic Function Desc: D Type; Frequency: 200MHz; Standoff Height: 0mm; Max Supply Voltage: 5.5V; Min Supply Voltage: 1.65V; Number Of Circuits: 1; Number Of Outputs: 2; Nominal Supply Current: 10uA; Manufacturer Part Number: SN74LVC1G74DCTR; Ambient Temperature Range High: +125°C; ComponentLink2Description: Datasheet; Device Class L2: Logic ICs; Digikey Description: IC FF D-TYPE SNGL 1BIT SM8; Height: 1.3mm; ComponentLink2URL: http://www.ti.com/lit/ds/symlink/sn74lvc1g74.pdf; Device Class L3: Latches and Flip Flops; Temperature: -40°C to +125°C; Ipc Land Pattern Name: SOP65P400X130-8; Lead Free: Yes; Octopart: https://octopart.com/sn74lvc1g74dctr-texas+instruments-12194016; Package: DCT0008A; Temperature Range Low: -40°C; Ambient Temperature Range Low: -40°C; Temperature Range High: +125°C; Category: IC; Device Class L1: Integrated Circuits (ICs); Mouser Description: Flip Flops Sgl Pos-Edge-Trggrd; RoHS: TRUE; Number Of Inputs: 1; Automotive: No
U305 = CMP-0859-00527-3: Dual 2-Input Positive-AND Gate, DCT0008A, LARGE T&R; Manufacturer: Texas Instruments; VCC(Max)(V): 5.5; Technology Family: LVC; Voltage(Nom)(V): 1.8,2.5,3.3,5; Input Type: CMOS/TTL; VCC(Min)(V): 1.65; Rating: Catalog; Output Type: CMOS; tpd @ Nom Voltage(Max)(ns): 9.8,5.8,5.3,4.8; Bits(#): 2; Gate Type: AND; 3-State Output: No; Output Drive (IOL/IOH)(Max)(mA): 32/-32; ICC @ Nom Voltage(Max)(mA): 0.01; Logic: True; F @ Nom Voltage(Max)(Mhz): 150; Operating Temperature Range(C): -40 to 125,-40 to 85; DatasheetVersion: SCES198M; Sub-Family: AND Gate; Schmitt Trigger: No; Generic Part Number: SN74LVC2G08; PackageReference: DCT0008A
U306 = CMP-0859-00134-4: IC INVERTER 1CH 1-INP SOT23-5; Number of Elements: 1; Turn-On Delay Time: 7.5ns; Propagation Delay: 3.7ns; Max Supply Voltage: 5.5V; Max Output Current: 32mA; Quiescent Current: 10uA; High Level Output Current: -32mA; Schmitt Trigger Input: No; Min Supply Voltage: 1.65V; Number of Circuits: 1; Lead Free: Lead Free; Number of Inputs: 1; Mount: Surface Mount; Length: 3.05mm; Width: 1.75mm; Number of Pins: 5; Case/Package: SOT-23; REACH SVHC: No SVHC; Low Level Output Current: 32mA; Package Quantity: 1; Height: 1.3mm; Radiation Hardening: No; Packaging: Tape and Reel; Output Current: 32mA; Max Operating Temperature: 125°C; Termination: SMD/SMT; Min Operating Temperature: -40°C; Number of Gates: 1; Weight: 0.000557oz; Logic Function: Inverter; Number of Bits: 1; Contact Plating: Tin

## Sheet 04_VIBRATION_FAULT.SchDoc
size A4; SheetNumber: 4; SheetTotal: 6
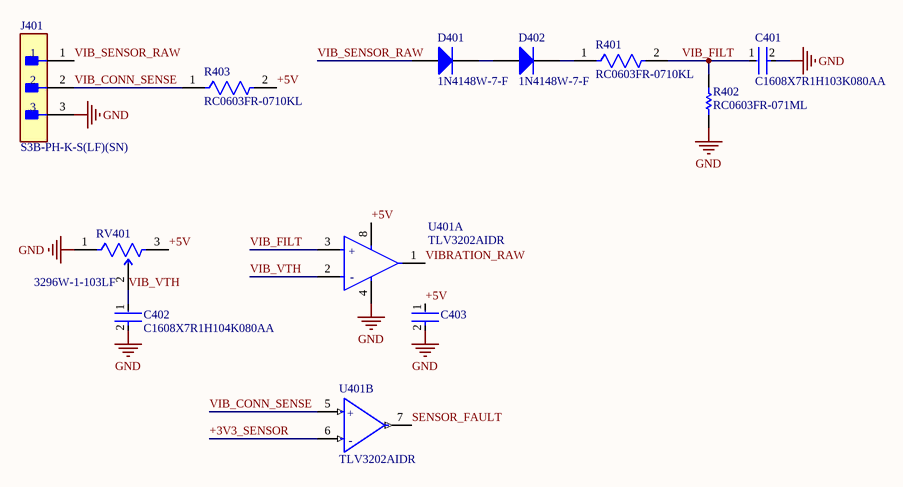
[diagram p3: 04_VIBRATION_FAULT.SchDoc]

### Parts
C401  C1608X7R1H103K080AA  [FP-C1608-080-0_1-MFG]
C402  C1608X7R1H104K080AA  [FP-C1608-080-0_1-IPC_B]
C403  C1608X7R1H104K080AA  [FP-C1608-080-0_1-IPC_B]  (value not drawn)
D401  1N4148W-7-F  [DIOD-SOD123-2_V]
D402  1N4148W-7-F  [DIOD-SOD123-2_V]
J401  S3B-PH-K-S(LF)(SN)  [FP-S3B-PH-K-S_LF_SN-MFG]
R401  RC0603FR-0710KL  [FP-RC0603-0_55-IPC_C]
R402  RC0603FR-071ML  [RESC1608X55X25LL10T15]
R403  RC0603FR-0710KL  [FP-RC0603-0_55-IPC_C]
RV401  3296W-1-103LF  [FP-3296W-MFG]
U401  TLV3202AIDR  [FP-D0008A-IPC_B]  (parts A,B of 2)

### Nets
GND: C401.2 C402.2 C403.2 J401.3 R402.2 RV401.1(CCW) U401.4(GND)
+3V3_SENSOR: U401.6(2IN-)
+5V: C403.1 R403.2 RV401.3(CW) U401.8(VCC)
SENSOR_FAULT: U401.7(2OUT)
VIB_CONN_SENSE: J401.2 R403.1 U401.5(2IN+)
VIB_FILT: C401.1 R401.2 R402.1 U401.3(1IN+)
VIB_SENSOR_RAW: D401.1(A) J401.1
VIB_VTH: C402.1 RV401.2(WIPER) U401.2(1IN-)
VIBRATION_RAW: U401.1(1OUT)
NetD401_2: D401.2(K) D402.1(A)
NetD402_2: D402.2(K) R401.1

### Notes on the sheet
- (in symbol CMP-04896-000095-1, part A) +; -
- (in symbol CMP-04896-000095-1, part B) +; -

### Library data of the parts
C401 = CMP-2000-06026-2: Multilayer Ceramic Capacitors 10nF ±10% 50V X7R SMD 0603; Voltage: 50V; Depth: 0.8mm; REACH SVHC: No SVHC; Packaging: Tape and Reel; Dielectric Material: Ceramic; Dielectric: X7R; Min Operating Temperature: -55°C; Package Quantity: 1; Width: 0.031inch; Case Code (Imperial): 0603; Radiation Hardening: No; Length: 1.6mm; RoHS Compliant: Yes; Tolerance: 10%; Termination: SMD/SMT; Mount: Surface Mount; Construction: Flat; Resistor Type: Ceramic; Max Operating Temperature: 125°C; Series: C; Lead Free: Lead Free; Capacitance: 10nF; Voltage Rating (DC): 50V; Thickness: 0.037inch; Voltage Rating: 50V; Height: 0.8mm; Weight: 7.1E-05oz; Case/Package: 0603; Case Code (Metric): 1608
C402 C403 = CMP-2000-04982-2: as C104 on sheet 01_POWER_IO; REACH SVHC: No SVHC; Voltage: 50V; Min Operating Temperature: -55°C; Package Quantity: 1; Case Code (Metric): 1608; Series: C; Termination: SMD/SMT; Length: 1.6mm; Voltage Rating: 50V; Case Code (Imperial): 0603; Number of Pins: 2; RoHS Compliant: Yes; Thickness: 0.037inch; Resistor Type: Ceramic; Radiation Hardening: No; Weight: 7.1E-05oz; Mount: Surface Mount; Capacitance: 100nF; Voltage Rating (DC): 50V; Construction: Flat; Tolerance: 10%; Lead Free: Lead Free; Case/Package: 0603; Max Operating Temperature: 125°C; Height: 0.8mm; Depth: 0.8mm; Packaging: Tape and Reel; Width: 0.031inch; Dielectric Material: Ceramic; Dielectric: X7R
D401 D402 = CMP-2000-04932-2: Fast Switching Diode, 100 V, 0.15 A, -65 to 150 degC, 2-Pin?SOD123, RoHS, Tape and Reel; Recovery Time: 4ns; Brand: DiodesIncorporated; Unit Weight: 0.000353oz; Max Surge Current: 2A; Peak Reverse Voltage: 100V; Ir - Reverse Current: 1uA; Vf - Forward Voltage: 1.25V; Configuration: Single; If - Forward Current: 0.15A; Product Category: Diodes-GeneralPurpose,Power,Switching; Operating Temperature Range: -65Cto+150C; Packaging: Reel; Manufacturer URL: http://www.diodes.com/; Maximum Operating Temperature: +150C; Height: 1.25mm; Minimum Operating Temperature: -65C; Product: SwitchingDiodes; Package URL: http://www.diodes.com/datasheets/ds18004.pdf; Type: SwitchingDiode; Package Reference: SOD123-2; Width: 1.7mm; Datasheet URL: http://www.farnell.com/datasheets/1915529.pdf; Datasheet Version: Rev. 24-2, 10/2013; Series: 1N4148; Factory Pack Quantity: 3000; Length: 2.85mm; RoHS: True; Manufacturer: DiodesIncorporated; Mounting Style: SMD/SMT; Package / Case: SOD-123
J401 = CMP-17439-000039-1: CONN HEADER R/A 3POS 2MM; Height: 0.31inch; Weight: 0.0625lb; Length: 0.31inch; Width: 0.31inch
R401 R403 = CMP-2100-03664-2: as R101 on sheet 01_POWER_IO; Depth: 0.8mm; Termination: SMD/SMT; Resistor Type: Thick Film; Series: RC; Construction: Rectangular; Features: Moisture Resistant; Packaging: Tape and Reel; Min Operating Temperature: -55°C; Number of Terminations: 2; Lead Pitch: 0.3mm; RoHS Compliant: Yes; Case/Package: 0603; Resistance Tolerance: 1%; Military Standard: Not; Weight: 7.1E-05oz; Number of Pins: 2; Tolerance: 1%; Length: 1.6mm; Case Code (Imperial): 0603; Lead Free: Lead Free; Width: 0.8mm; Max Power Dissipation: 100mW; Height: 0.45mm; Max Operating Temperature: 155°C; Case Code (Metric): 1608; Size Code: 0603
R402 = CMP-1659-00056-1: as R201 on sheet 02_DISPLACEMENT; Min Operating Temperature: -40 degC; PackageDescription: 2-Pin Surface Mount Device, Body 1.6 x 0.8 mm; ComponentLink1Description: Manufacturer URL; Radiation Hardening: No; DatasheetVersion: Rev. 4, 02/2016; REACH SVHC: No SVHC; Length: 20 mm; Max Operating Temperature: 85 degC; Diameter: 10 mm; Packaging: Bulk; Package Quantity: 200; PackageReference: 0603; Mount: Through Hole; ComponentLink1URL: http://www.yageo.com/; ComponentLink2URL: http://www.yageo.com/documents/recent/PYu-RC_Group_51_RoHS_L_04.pdf; ComponentLink2Description: Datasheet; Width: 0 inch; Lead Pitch: 5 mm; RoHSCompliant: true; Voltage Rating: 25 V; Height: 20 mm
RV401 = CMP-1747-00001-8: as RV201 on sheet 02_DISPLACEMENT; Min Operating Temperature: -55°C; Resistor Type: Cermet; Series: 3296; Color: Blue; Mount: Through Hole; Taper: Linear; Radiation Hardening: No; RoHS Compliant: Yes; Width: 9.53mm; Resistance Tolerance: 10%; Contact Plating: Tin; Military Standard: Not; Package Quantity: 50; Weight: 0.03oz; Lead Free: Lead Free; Power Rating: 500mW; Termination: Pin; Technology: CERMET; Max Operating Temperature: 125°C; Packaging: Rail/Tube; Length: 9.53mm; Depth: 4.83mm; Height: 11.55mm; Reach SVHC Compliant: Yes
U401 = CMP-04896-000095-1: as U201 on sheet 02_DISPLACEMENT; Number of Pins: 8; Series: TLV3202; Type: General Purpose; Max Operating Temperature: 125°C; Packaging: Tape and Reel; Mount: Surface Mount; Max Input Current: 50pA; RoHS Compliant: Yes; Package Quantity: 2500; Case/Package: SOIC; Radiation Hardening: No; Contact Plating: Gold; Min Operating Temperature: -40°C; Number of Elements: 2; Lead Free: Lead Free; Supply Current: 50uA; Nominal Supply Current: 50uA

## Sheet 05_RISK_MEMORY.SchDoc
size A4; SheetNumber: 5; SheetTotal: 6
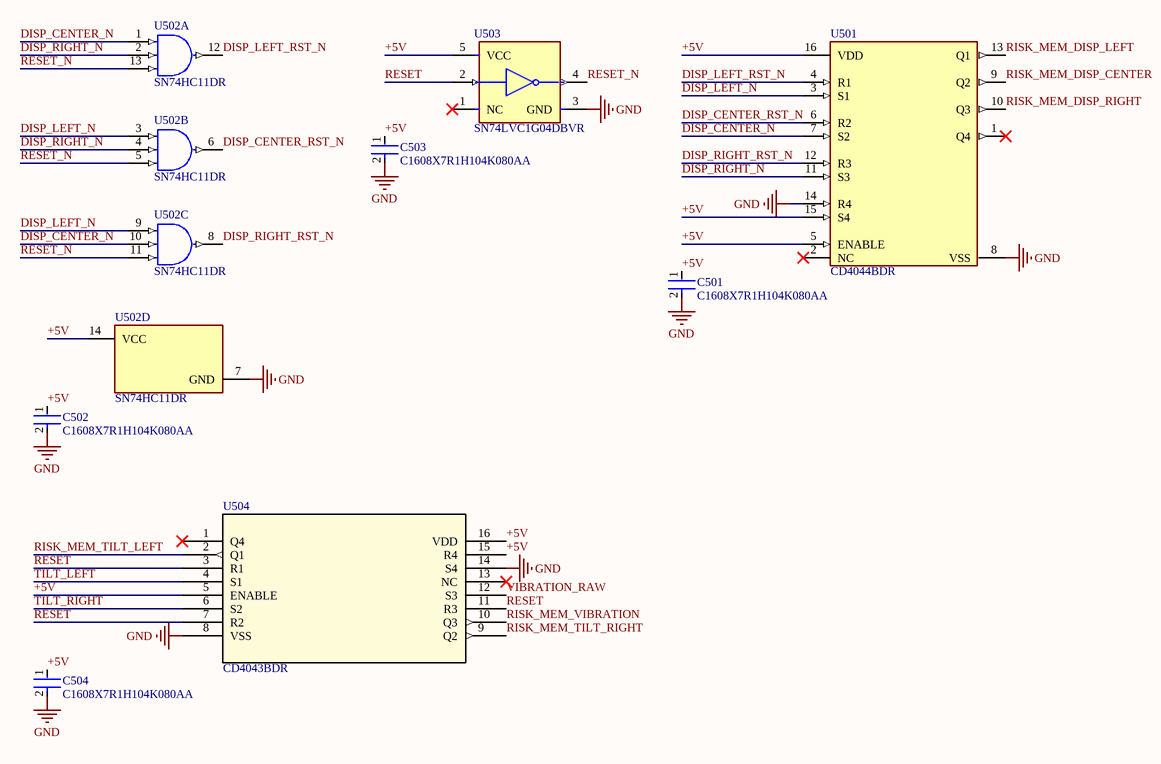
[diagram p4: 05_RISK_MEMORY.SchDoc]

### Parts
C501  C1608X7R1H104K080AA  [FP-C1608-080-0_1-IPC_B]
C502  C1608X7R1H104K080AA  [FP-C1608-080-0_1-IPC_B]
C503  C1608X7R1H104K080AA  [FP-C1608-080-0_1-IPC_B]
C504  C1608X7R1H104K080AA  [FP-C1608-080-0_1-IPC_B]
U501  CD4044BDR  [FP-D0016A-IPC_C]
U502  SN74HC11DR  [FP-D0014A-IPC_C]  (parts A,B,C,D of 4)
U503  SN74LVC1G04DBVR  [FP-DBV0005A-MFG]
U504  CD4043BDR  [D16]

### Nets
GND: C501.2 C502.2 C503.2 C504.2 U501.8(VSS) U501.14(R4) U502.7(GND) U503.3(GND) U504.8(VSS) U504.14(S4)
+5V: C501.1 C502.1 C503.1 C504.1 U501.5(ENABLE) U501.15(S4) U501.16(VDD) U502.14(VCC) U503.5(VCC) U504.5(ENABLE) U504.15(R4) U504.16(VDD)
DISP_CENTER_N: U501.7(S2) U502.1(1A) U502.10(3B)
DISP_CENTER_RST_N: U501.6(R2) U502.6(2Y)
DISP_LEFT_N: U501.3(S1) U502.3(2A) U502.9(3A)
DISP_LEFT_RST_N: U501.4(R1) U502.12(1Y)
DISP_RIGHT_N: U501.11(S3) U502.2(1B) U502.4(2B)
DISP_RIGHT_RST_N: U501.12(R3) U502.8(3Y)
RESET: U503.2(A) U504.3(R1) U504.7(R2) U504.11(R3)
RESET_N: U502.5(2C) U502.11(3C) U502.13(1C) U503.4(Y)
RISK_MEM_DISP_CENTER: U501.9(Q2)
RISK_MEM_DISP_LEFT: U501.13(Q1)
RISK_MEM_DISP_RIGHT: U501.10(Q3)
RISK_MEM_TILT_LEFT: U504.2(Q1)
RISK_MEM_TILT_RIGHT: U504.9(Q2)
RISK_MEM_VIBRATION: U504.10(Q3)
TILT_LEFT: U504.4(S1)
TILT_RIGHT: U504.6(S2)
VIBRATION_RAW: U504.12(S3)

Not connected (* = marked no-connect by the designer): U501 1(Q4)* 2(NC)*; U503 1(NC)*; U504 1(Q4)* 13(NC)*

### Library data of the parts
C501-C504 = CMP-2000-04982-2: as C104 on sheet 01_POWER_IO; REACH SVHC: No SVHC; Voltage: 50V; Min Operating Temperature: -55°C; Package Quantity: 1; Case Code (Metric): 1608; Series: C; Termination: SMD/SMT; Length: 1.6mm; Voltage Rating: 50V; Case Code (Imperial): 0603; Number of Pins: 2; RoHS Compliant: Yes; Thickness: 0.037inch; Resistor Type: Ceramic; Radiation Hardening: No; Weight: 7.1E-05oz; Mount: Surface Mount; Capacitance: 100nF; Voltage Rating (DC): 50V; Construction: Flat; Tolerance: 10%; Lead Free: Lead Free; Case/Package: 0603; Max Operating Temperature: 125°C; Height: 0.8mm; Depth: 0.8mm; Packaging: Tape and Reel; Width: 0.031inch; Dielectric Material: Ceramic; Dielectric: X7R
U501 = CMP-04902-000018-1: IC QUAD NAND R/S LATCH 16SOIC; Polarity: Non-Inverting; Min Supply Voltage: 3V; Number of Output Lines: 4; Output Type: 3-STATE; Max Supply Voltage: 18V; Turn-On Delay Time: 50ns; Number of Elements: 1; Number of Input Lines: 8; Output Current: 6.8mA; High Level Output Current: -4.2mA; Low Level Output Current: 4.2mA; Quiescent Current: 20uA; Propagation Delay: 300ns; Mount: Surface Mount; Packaging: Tape and Reel; Weight: 0.004998oz; Contact Plating: Gold; Independent Circuits: 4; Number of Pins: 16; Number of Bits: 4; Max Operating Temperature: 125°C; Radiation Hardening: No; Case/Package: SOIC; Number of Circuits: 1; Technology: CMOS; Min Operating Temperature: -55°C; Package Quantity: 1; Lead Free: Lead Free; RoHS Compliant: Yes; Logic Function: Latch; Series: 4000B
U502 = CMP-0777-00002-4: IC GATE AND 3CH 3-INP 14SOIC; Number of Gates: 3; High Level Output Current: -5.2mA; Max Supply Voltage: 6V; Low Level Output Current: 5.2mA; Quiescent Current: 2uA; Number of Outputs: 1; Propagation Delay: 17ns; Turn-On Delay Time: 25ns; Output Current: 25mA; Operating Supply Voltage: 5V; Min Supply Voltage: 2V; Logic Function: AND GATE; Max Operating Temperature: 85°C; Package Quantity: 1; Weight: 0.004318oz; Contact Plating: Gold; Number of Input Lines: 3; Packaging: Tape and Reel; Radiation Hardening: No; Number of Circuits: 3; Number of Elements: 3; Number of Pins: 14; Lead Free: Lead Free; Case/Package: SOIC; Number of Inputs: 3; Mount: Surface Mount; Min Operating Temperature: -40°C; Number of Bits: 3; Number of Output Lines: 1; REACH SVHC: No SVHC; RoHS Compliant: Yes
U503 = CMP-0859-00134-4: as U306 on sheet 03_TILT_REF; Number of Circuits: 1; Lead Free: Lead Free; Number of Inputs: 1; Mount: Surface Mount; Length: 3.05mm; Width: 1.75mm; Number of Pins: 5; Case/Package: SOT-23; REACH SVHC: No SVHC; Low Level Output Current: 32mA; Package Quantity: 1; Height: 1.3mm; Radiation Hardening: No; Packaging: Tape and Reel; Output Current: 32mA; Max Operating Temperature: 125°C; Termination: SMD/SMT; Min Operating Temperature: -40°C; Number of Gates: 1; Weight: 0.000557oz; Logic Function: Inverter; Number of Bits: 1; Contact Plating: Tin
U504 = CD4043BDR: CMOS Quad NOR R/S Latch with 3-State Outputs 16-SOIC -55 to 125; Manufacturer_Name: Texas Instruments; Copyright: Copyright (C) 2025 Ultra Librarian. All rights reserved.; Manufacturer_Part_Number: CD4043BDR; RefDes: RefDes; Type: Type